# Altium project PCB_Project.PrjPcb (part 6 of 8)
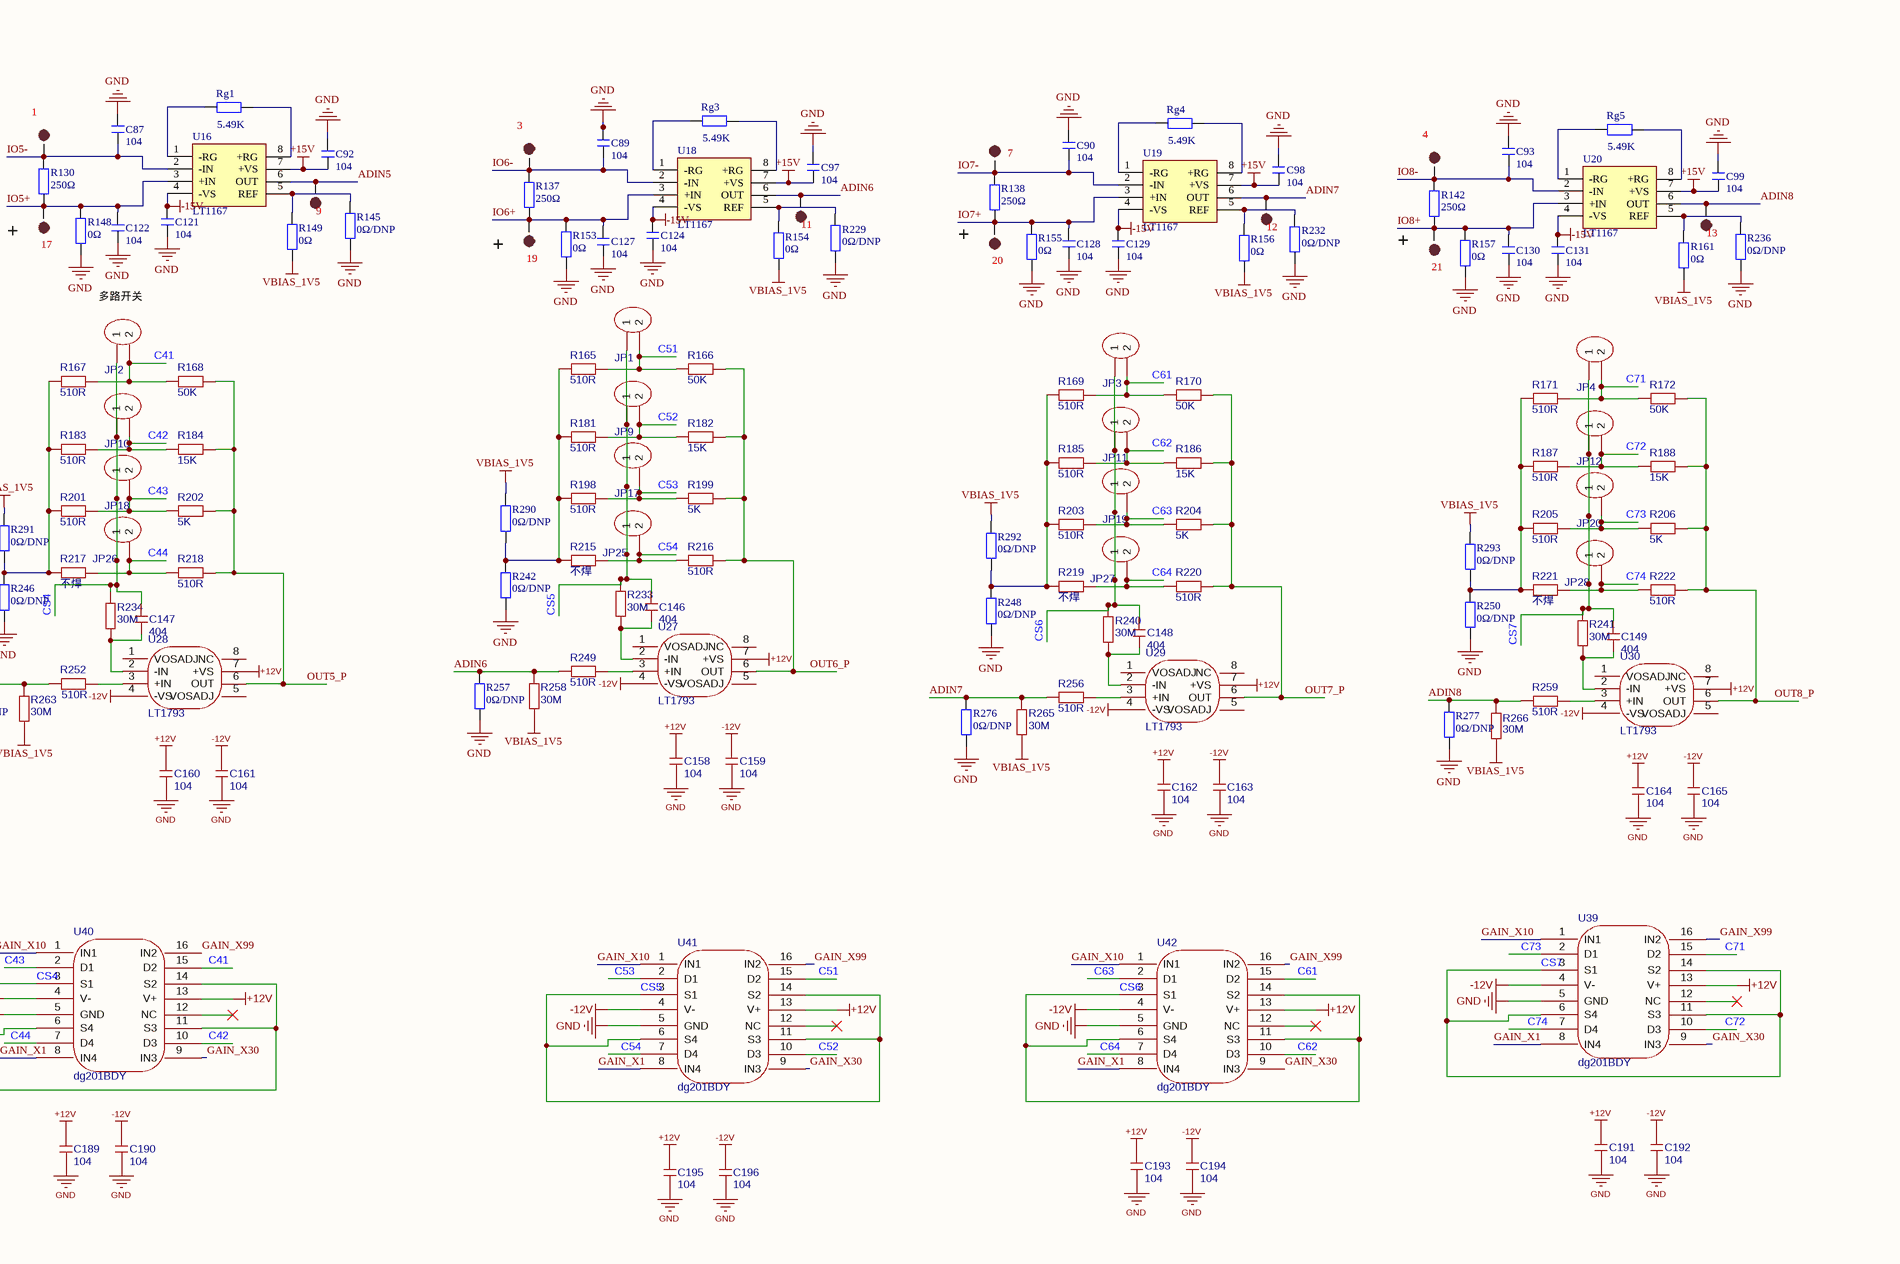
[diagram p107: DSP大板子.SchDoc, bottom right]

## Sheet DSP大板子.SchDoc (continued)
### Library data of the parts (continued)
JP29 = Header 2: 2P接插件; 版权归属: 封装库来自淘宝 ID：黄晶宝石; Origin Footprint: XH2.54-WI-2P; OriginFootprint 2: XH2.54-LI-2P; OriginFootprint 3: HDR2.54-M-LI-2P; OriginFootprint 4: HDR2.54-WI-2P; OriginFootprint 5: HDR2.54-WS-2P; OriginFootprint 7: HDR2.54-M-WS-2P; OriginFootprint 8: KF2510-LI-2P; OriginFootprint 9: XH2.54-WS-2P; OriginFootprint 10: XH2.54-LS-2P; OriginFootprint 11: KF2EDGK-2.54-LI-2P; OriginFootprint 12: KF2EDGK-2.54-WI-2P; UniqueId: 12cb931c49908c91; AddInBom: yes; OriginModelName: HDR2.54-1P; Device: Header 2; BOM名称: 2P接插件; 联系售后: https://shop463601444.taobao.com; OriginFootprint 6: HDR2.54-Y-LI-2P; DesignItemID: Header 2; LibraryName: 5.4 - 接插件-脚距2.54 (100mil); SymbolName: Header 2; FootprintName: HDR2.54-LI-2P
JP30 = Header 2: 2P接插件; 版权归属: 封装库来自淘宝 ID：黄晶宝石; Origin Footprint: XH2.54-WI-2P; OriginFootprint 2: XH2.54-LI-2P; OriginFootprint 3: HDR2.54-M-LI-2P; OriginFootprint 4: HDR2.54-WI-2P; OriginFootprint 5: HDR2.54-WS-2P; OriginFootprint 7: HDR2.54-M-WS-2P; OriginFootprint 8: KF2510-LI-2P; OriginFootprint 9: XH2.54-WS-2P; OriginFootprint 10: XH2.54-LS-2P; OriginFootprint 11: KF2EDGK-2.54-LI-2P; OriginFootprint 12: KF2EDGK-2.54-WI-2P; UniqueId: c76a900f0ccf0344; AddInBom: yes; OriginModelName: HDR2.54-1P; Device: Header 2; BOM名称: 2P接插件; 联系售后: https://shop463601444.taobao.com; OriginFootprint 6: HDR2.54-Y-LI-2P; DesignItemID: Header 2; LibraryName: 5.4 - 接插件-脚距2.54 (100mil); SymbolName: Header 2; FootprintName: HDR2.54-LI-2P
JP31 = Header 2: 2P接插件; 版权归属: 封装库来自淘宝 ID：黄晶宝石; Origin Footprint: XH2.54-WI-2P; OriginFootprint 2: XH2.54-LI-2P; OriginFootprint 3: HDR2.54-M-LI-2P; OriginFootprint 4: HDR2.54-WI-2P; OriginFootprint 5: HDR2.54-WS-2P; OriginFootprint 7: HDR2.54-M-WS-2P; OriginFootprint 8: KF2510-LI-2P; OriginFootprint 9: XH2.54-WS-2P; OriginFootprint 10: XH2.54-LS-2P; OriginFootprint 11: KF2EDGK-2.54-LI-2P; OriginFootprint 12: KF2EDGK-2.54-WI-2P; UniqueId: 3883b53b87c5b88a; AddInBom: yes; OriginModelName: HDR2.54-1P; Device: Header 2; BOM名称: 2P接插件; 联系售后: https://shop463601444.taobao.com; OriginFootprint 6: HDR2.54-Y-LI-2P; DesignItemID: Header 2; LibraryName: 5.4 - 接插件-脚距2.54 (100mil); SymbolName: Header 2; FootprintName: HDR2.54-LI-2P
JP32 = Header 2: 2P接插件; 版权归属: 封装库来自淘宝 ID：黄晶宝石; Origin Footprint: XH2.54-WI-2P; OriginFootprint 2: XH2.54-LI-2P; OriginFootprint 3: HDR2.54-M-LI-2P; OriginFootprint 4: HDR2.54-WI-2P; OriginFootprint 5: HDR2.54-WS-2P; OriginFootprint 7: HDR2.54-M-WS-2P; OriginFootprint 8: KF2510-LI-2P; OriginFootprint 9: XH2.54-WS-2P; OriginFootprint 10: XH2.54-LS-2P; OriginFootprint 11: KF2EDGK-2.54-LI-2P; OriginFootprint 12: KF2EDGK-2.54-WI-2P; UniqueId: 4fe8deccf3ecd12b; AddInBom: yes; OriginModelName: HDR2.54-1P; Device: Header 2; BOM名称: 2P接插件; 联系售后: https://shop463601444.taobao.com; OriginFootprint 6: HDR2.54-Y-LI-2P; DesignItemID: Header 2; LibraryName: 5.4 - 接插件-脚距2.54 (100mil); SymbolName: Header 2; FootprintName: HDR2.54-LI-2P
JTAG1 = 2.54-2*7P简牛: Manufacturer: BOOMELE(博穆精密); Symbol: HDR-IDC-2.54-2X7P; Add into BOM: yes; Connector Type: 简牛座; Pitch: 2.54mm; Structure: 2x7P; Holder Type: 直插; Pin Number in each Row: 7; Device: 2.54-2*7P简牛; LCSC Part Name: 2.54mm 2x7P 排数:2 每排P数:7; Supplier Part: C11215; Manufacturer Part: 2.54-2*7P简牛; Supplier Footprint: 插件,P=2.54mm; JLCPCB Part Class: 扩展库; Datasheet: https://atta.szlcsc.com/upload/public/pdf/source/20131122/1457706661483.pdf; Supplier: LCSC; Convert to PCB: yes; Row Spacing: 2.54mm; Number of Rows: 2; Contact Material: 黄铜; Contact Plating: 金
L1 = blm18kg601sn1d: 阻抗@频率:600Ω@100MHz;误差:±25%;直流电阻(DCR):150mΩ;; Manufacturer: muRata(村田); AddInBom: yes; ModelId: 2bc5ec593d464d6ba9807aec0b5673c2; ModelName: L0603_L1.6-W0.8-H0.5_BEAD; ModelTransform: 62.992,31.496,0,180,0,0,0.094,0.629,0; Tolerance: ±25%; DC Resistance(DCR): 150mΩ; Current Rating: 1.3A; Number of Circuits: 1; Symbol: BLM18KG601SN1D; LCSC Part Name: 单路 0603磁珠 阻抗600Ω@100MHz; SupplierPart: C85833; ManufacturerPart: BLM18KG601SN1D; Supplier Footprint: 0603; JLCPCB Part Class: Extended Part; Datasheet: https://item.szlcsc.com/datasheet/BLM18KG601SN1D/87009.html; Supplier: LCSC; ConvertToPcb: yes; FootprintName: L0603; Impedance @ Frequency: 600Ω@100MHz; Operating Temperature: -55℃~+125℃
L2 = mpz1608s221ata00: 标称阻抗@测试频率:220Ω@100MHz;误差:±25%;直流电阻(RDC):50mΩ;; Manufacturer: TDK; AddInBom: yes; ModelId: 2bc5ec593d464d6ba9807aec0b5673c2; ModelName: L0603_L1.6-W0.8-H0.5_BEAD; ModelTransform: 62.992,31.496,0,180,0,0,0.094,0.629,0; Tolerance: ±25%; DC Resistance: 50mΩ; Current Rating: 2.2A; Circuits: 1; Symbol: MPZ1608S221ATA00; LCSC Part Name: 单路 0603磁珠 阻抗220Ω@100MHz; SupplierPart: C76815; ManufacturerPart: MPZ1608S221ATA00; Supplier Footprint: 0603; JLCPCB Part Class: Extended Part; Datasheet: https://atta.szlcsc.com/upload/public/pdf/source/20160918/1474166931723.pdf; Supplier: LCSC; ConvertToPcb: yes; FootprintName: L0603; Impedance @ Frequency: 220Ω@100MHz
L3 = 7447798720: 电感值:7.2uH;精度:±30%;额定电流:7.9A;饱和电流(Isat):6A;类型:-;; Manufacturer: Wurth(伍尔特); AddInBom: yes; ModelId: 669184afeb3a41a69bd447d1aa3c6b52; ModelTransform: 401.574,402.3614,0,270,0,0,0,0,0; Value: 7.2uH; Tolerance: ±30%; Current Rating: 7.9A; Current - Saturation(Isat): 6A; DC Resistance(DCR): 12.8mΩ; Symbol: 7447798720; LCSC Part Name: 7.2uH ±30% 6A; SupplierPart: C105681; ManufacturerPart: 7447798720; Supplier Footprint: SMD,10.2x10.2mm; JLCPCB Part Class: Extended Part; Datasheet: https://www.we-online.com/components/products/datasheet/7447798720.pdf; Supplier: LCSC; ConvertToPcb: yes; FootprintName: IND-SMD_L10.2-W10.2_7447798720; ModelName: IND-SMD_L10.2-W10.2_7447798720; Type: -; Ratings: -
L4 = Inductor: Code_IEC: 1005; Value: 15uH   0.6A; Published: 8-Jun-2000; LatestRevisionDate: 29-May-2009; LatestRevisionNote: IPC-7351 Footprint Added.; PackageReference: 0402-A; Publisher: Altium Limited; PackageDescription: Chip Inductor; Code_JEITA: 0402
L5 L7 = blm31pg121sn1l: 阻抗@频率:120Ω@100MHz;误差:±25%;直流电阻(DCR):20mΩ;; Manufacturer: muRata(村田); AddInBom: yes; ModelId: 85bdab7b3d4c4074b81d208eb5e865b3; ModelName: L1206_L3.2-W1.6-H1.1; ModelTransform: 125.984,62.835,0,0,0,0,0,0,0; Tolerance: ±25%; DC Resistance(DCR): 20mΩ; Current Rating: 3.5A; Number of Circuits: 1; Symbol: BLM31PG121SN1L; LCSC Part Name: 单路 1206磁珠 阻抗120Ω@100MHz; SupplierPart: C85841; ManufacturerPart: BLM31PG121SN1L; Supplier Footprint: 1206; JLCPCB Part Class: Extended Part; Datasheet: https://item.szlcsc.com/datasheet/BLM31PG121SN1L/87017.html; Supplier: LCSC; ConvertToPcb: yes; FootprintName: L1206; Impedance @ Frequency: 120Ω@100MHz; Operating Temperature: -55℃~+125℃
L6 = srn6045ta-4r7m: 电感值:4.7uH;精度:±20%;额定电流:4.5A;饱和电流(Isat):6.8A;类型:-;; Manufacturer: BOURNS; AddInBom: yes; ModelId: 30081a2752cd45e4871fd4480d5f295c; ModelName: IND-SMD_L6.0-W6.0-H4.5; ModelTransform: 236.22,237.007,0,90,0,0,-0.005,0,0; Value: 4.7uH; Tolerance: ±20%; Current Rating: 4.5A; Current - Saturation(Isat): 6.8A; DC Resistance(DCR): 26mΩ; Symbol: SRN6045TA-4R7M; LCSC Part Name: 4.7uH ±20% 6.8A; SupplierPart: C2044594; ManufacturerPart: SRN6045TA-4R7M; Supplier Footprint: SMD,6x6mm; JLCPCB Part Class: Extended Part; Datasheet: https://item.szlcsc.com/datasheet/SRN6045TA-4R7M/2136160.html; Supplier: LCSC; ConvertToPcb: yes; FootprintName: IND-SMD_L6.0-W6.0; Type: -
OSC1 = ot2el4c4ji-111olp-24.576m: 频率:24.576MHz;常温频差:±10ppm;输出模式:CMOS;工作电压:1.8V~3.3V;频率稳定度:±20ppm;; Manufacturer: YXC(扬兴晶振); AddInBom: yes; ModelId: ae22b8d143894765bc8100c37cb6356f; ModelName: OSC-SMD_4P-L3.2-W2.5-H1.0; ModelTransform: 125.984,98.425,0,0,0,0,0,0,0; Normal temperature Frequency Tolerance: ±10ppm; Output Type: CMOS; Frequency Stability: ±20ppm; Symbol: OT2EL4C4JI-111OLP-24.576M; LCSC Part Name: YSO110TR 24.576MHZ 1.8V-3.3V ±10PPM -40~85℃（±20PPM) CMOS; SupplierPart: C5203547; ManufacturerPart: OT2EL4C4JI-111OLP-24.576M; Supplier Footprint: SMD3225-4P; JLCPCB Part Class: Extended Part; Datasheet: https://item.szlcsc.com/datasheet/OT2EL4C4JI-111OLP-24.576M/5892909.html; Supplier: LCSC; ConvertToPcb: yes; FootprintName: OSC-SMD_4P-L3.2-W2.5-BL; Value: 24.576MHz; Voltage - Supply: 1.8V~3.3V; Operating Temperature: -40℃~+85℃
P1 = wj500v-5.08-03p-14-00a: 结构:1x3P;间距:5.08mm;颜色:绿色;安装类型:直插;排数:1;每排PIN数:3;额定电流:18A;额定电压:250V;线规 - AWG:14~30;线规 - 平方毫米:2.5;工作温度:-40℃~+105℃;; Manufacturer: KANGNEX(康奈克斯电气); Symbol: WJ500V-5.08-3P-14-00A; AddInBom: yes; ModelId: f80d5090781743d49abcb05979f5618f; ModelTransform: 623.621,393.7,0,0,0,0,11.811,-20.315,-177.165; Number of Positions or Pins: 1x3P; Pitch: 5.08mm; Number of PINs Per Row: 3; Screw Specification: M2.5; Current Rating: 18A; Voltage Rating (Max): 250V; Wire Gauge - AWG: 14~30; Wire Gauge - mm2: 2.5; LCSC Part Name: 1x3P 5.08mm 直插 排数:1 每排P数:3; SupplierPart: C72334; ManufacturerPart: WJ500V-5.08-03P-14-00A; Supplier Footprint: 插件,P=5.08mm; JLCPCB Part Class: Extended Part; Datasheet: https://item.szlcsc.com/datasheet/WJ500V-5.08-03P-14-00A/73443.html; Supplier: LCSC; ConvertToPcb: yes; FootprintName: CONN-TH_3P-P5.00_WJ500V-5.08-3P; ModelName: CONN-TH_3P-P5.00_WJ500V-5.08-3P; Color: 绿色; Mounting Type: 直插; Number of Pins: 3P; Number of Rows: 1; Operating Temperature: -40℃~+105℃; Height Above Board: 14.07mm
P2 = Header 2: Header, 2-Pin; LatestRevisionDate: 17-Jul-2002; LatestRevisionNote: Re-released for DXP Platform.; Publisher: Altium Limited
Q1 = 2n7002,215: 数量:1个N沟道;漏源电压(Vdss):60V;连续漏极电流(Id):300mA;导通电阻(RDS(on)):5Ω@10V;耗散功率(Pd):830mW;阈值电压(Vgs(th)):2.5V;; Manufacturer: Nexperia(安世); AddInBom: yes; ModelId: c62791f0466c4ae2a892c056b845b0ca; ModelName: SOT-23-3P_L2.9-W1.3-H1.0-LS2.4-P0.95; ModelTransform: 98.64468,114.173,0,180,0,0,0.001,-0.002,0; Number: 1个N沟道; Drain to Source Voltage: 60V; Current - Continuous Drain(Id): 300mA; RDS(on): 5Ω@10V; Pd - Power Dissipation: 830mW; Gate Threshold Voltage (Vgs(th)): 2.5V; Input Capacitance(Ciss): 50pF; Reverse Transfer Capacitance (Crss@Vds): 3.5pF; Type: N沟道; Output Capacitance(Coss): 6.8pF; Vgs: ±30V; Symbol: 2N7002,215; LCSC Part Name: 1个N沟道 耐压:60V 电流:300mA; SupplierPart: C65189; ManufacturerPart: 2N7002,215; Supplier Footprint: SOT-23; JLCPCB Part Class: Extended Part; Datasheet: https://item.szlcsc.com/datasheet/2N7002%252C215/66260.html; Supplier: LCSC; ConvertToPcb: yes; FootprintName: SOT-23_L2.9-W1.3-P1.90-LS2.4-BR; Gate Charge(Qg): -; Operating Temperature: -65℃~+150℃; Configuration: -
Q2 = dmp6023le-13: 数量:1个P沟道;漏源电压(Vdss):60V;连续漏极电流(Id):7A;导通电阻(RDS(on)):35mΩ@4.5V;耗散功率(Pd):2W;阈值电压(Vgs(th)):3V;; Manufacturer: DIODES(美台); AddInBom: yes; ModelId: 925194bf9823436183a3e0b978a8d076; ModelName: SOT-223-4P_L6.5-W3.5-H1.6-LS7.0-P2.30; ModelTransform: 279.89794,255.905,0,180,0,0,-0.0005,-0.0005,0; Number: 1个P沟道; Drain to Source Voltage: 60V; Current - Continuous Drain(Id): 7A; Pd - Power Dissipation: 2W; Gate Threshold Voltage (Vgs(th)): 3V; Gate Charge(Qg): 53.1nC@10V; Input Capacitance(Ciss): 2.569nF; Reverse Transfer Capacitance (Crss@Vds): 143pF; Type: P沟道; Output Capacitance(Coss): 179pF; Symbol: DMP6023LE-13; LCSC Part Name: 1个P沟道 耐压:60V 电流:7A; SupplierPart: C154901; ManufacturerPart: DMP6023LE-13; Supplier Footprint: SOT-223; JLCPCB Part Class: Extended Part; Datasheet: https://item.szlcsc.com/datasheet/DMP6023LE-13/166243.html; Supplier: LCSC; ConvertToPcb: yes; FootprintName: SOT-223-4_L6.5-W3.5-P2.30-LS7.0-BR; RDS(on): 35mΩ@4.5V; Operating Temperature: -55℃~+150℃
R1 R5 R10 R15 R30 R32-R34 R41 R42 R44 R45 R49 R51 R54 R55 R72 R75 R76 R78-R81 R83-R85 R90 R92-R94 R96-R119 R121 R122 R124 R125 R127-R132 R136-R138 R142-R164 R195 R200 R229 R232 R235-R239 R242 R246 R248 R250 R251 R253-R255 R257 R273 R275-R303 Rg1-Rg8 = R: 贴片电阻; 版权归属: 来自淘宝 ID：黄晶宝石; 封装库来自淘宝卖家 ID：黄晶宝石: 其他店铺购入均为盗版，不享受售后技术支持服务，请立即申请退款; BOM名称: 贴片电阻; 联系售后: https://shop463601444.taobao.com
R2-R4 R6-R9 R11-R14 R16 R17 R19-R23 R25 R29 R35-R40 R43 R46-R48 R50 R52 R53 R56-R62 R65 R67 R69-R71 R73 R74 R77 R82 R86 R87 R89 R91 R95 R120 R123 R126 R133-R135 R139-R141 = R: 贴片电阻; 版权归属: 源创客; BOM名称: 贴片电阻; 学习资源: www.ooocke.com
R18 R24 R26-R28 R31 R63 R64 R66 R68 = R_10: 贴片电阻; 版权归属: 源创客; BOM名称: 贴片电阻; 学习资源: www.ooocke.com
R88 = R: 贴片电阻1%; BOM名称: 贴片电阻; 版权归属: 来自淘宝 ID：黄晶宝石; 封装库来自淘宝卖家 ID：黄晶宝石: 其他店铺购入均为盗版，不享受售后技术支持服务，请立即申请退款; 联系售后: https://shop463601444.taobao.com
R165 = R: 贴片电阻; 版权归属: 来自淘宝 ID：黄晶宝石; 封装库来自淘宝卖家 ID：黄晶宝石: 其他店铺购入均为盗版，不享受售后技术支持服务，请立即申请退款; Origin Footprint: R 0201_L; OriginFootprint 2: R 0402_L; OriginFootprint 3: R 0805_L; OriginFootprint 4: R 1206_L; OriginFootprint 5: R 1210_L; OriginFootprint 6: R 1812_L; OriginFootprint 7: R 2010_L; OriginFootprint 8: R 2512_L; OriginFootprint 9: R 0201_M; OriginFootprint 10: R 0402_M; OriginFootprint 11: R 0603_M; OriginFootprint 12: R 0805_M; OriginFootprint 13: R 1206_M; OriginFootprint 14: R 1210_M; OriginFootprint 15: R 1812_M; OriginFootprint 16: R 2010_M; OriginFootprint 17: R 2512_M; UniqueId: 60493bf970b6a222; AddInBom: yes; OriginModelName: R 0603; Device: R; BOM名称: 贴片电阻; 联系售后: https://shop463601444.taobao.com; DesignItemID: R; LibraryName: 0.1 - 电阻-电容-电感; SymbolName: R; FootprintName: R 0603_L
R166 = R: 贴片电阻; 版权归属: 来自淘宝 ID：黄晶宝石; 封装库来自淘宝卖家 ID：黄晶宝石: 其他店铺购入均为盗版，不享受售后技术支持服务，请立即申请退款; Origin Footprint: R 0201_L; OriginFootprint 2: R 0402_L; OriginFootprint 3: R 0805_L; OriginFootprint 4: R 1206_L; OriginFootprint 5: R 1210_L; OriginFootprint 6: R 1812_L; OriginFootprint 7: R 2010_L; OriginFootprint 8: R 2512_L; OriginFootprint 9: R 0201_M; OriginFootprint 10: R 0402_M; OriginFootprint 11: R 0603_M; OriginFootprint 12: R 0805_M; OriginFootprint 13: R 1206_M; OriginFootprint 14: R 1210_M; OriginFootprint 15: R 1812_M; OriginFootprint 16: R 2010_M; OriginFootprint 17: R 2512_M; UniqueId: 4cc02cdac8efc8e2; AddInBom: yes; OriginModelName: R 0603; Device: R; BOM名称: 贴片电阻; 联系售后: https://shop463601444.taobao.com; DesignItemID: R; LibraryName: 0.1 - 电阻-电容-电感; SymbolName: R; FootprintName: R 0603_L
R167 = R: 贴片电阻; 版权归属: 来自淘宝 ID：黄晶宝石; 封装库来自淘宝卖家 ID：黄晶宝石: 其他店铺购入均为盗版，不享受售后技术支持服务，请立即申请退款; Origin Footprint: R 0201_L; OriginFootprint 2: R 0402_L; OriginFootprint 3: R 0805_L; OriginFootprint 4: R 1206_L; OriginFootprint 5: R 1210_L; OriginFootprint 6: R 1812_L; OriginFootprint 7: R 2010_L; OriginFootprint 8: R 2512_L; OriginFootprint 9: R 0201_M; OriginFootprint 10: R 0402_M; OriginFootprint 11: R 0603_M; OriginFootprint 12: R 0805_M; OriginFootprint 13: R 1206_M; OriginFootprint 14: R 1210_M; OriginFootprint 15: R 1812_M; OriginFootprint 16: R 2010_M; OriginFootprint 17: R 2512_M; UniqueId: ef32c3a96261eb70; AddInBom: yes; OriginModelName: R 0603; Device: R; BOM名称: 贴片电阻; 联系售后: https://shop463601444.taobao.com; DesignItemID: R; LibraryName: 0.1 - 电阻-电容-电感; SymbolName: R; FootprintName: R 0603_L
R168 = R: 贴片电阻; 版权归属: 来自淘宝 ID：黄晶宝石; 封装库来自淘宝卖家 ID：黄晶宝石: 其他店铺购入均为盗版，不享受售后技术支持服务，请立即申请退款; Origin Footprint: R 0201_L; OriginFootprint 2: R 0402_L; OriginFootprint 3: R 0805_L; OriginFootprint 4: R 1206_L; OriginFootprint 5: R 1210_L; OriginFootprint 6: R 1812_L; OriginFootprint 7: R 2010_L; OriginFootprint 8: R 2512_L; OriginFootprint 9: R 0201_M; OriginFootprint 10: R 0402_M; OriginFootprint 11: R 0603_M; OriginFootprint 12: R 0805_M; OriginFootprint 13: R 1206_M; OriginFootprint 14: R 1210_M; OriginFootprint 15: R 1812_M; OriginFootprint 16: R 2010_M; OriginFootprint 17: R 2512_M; UniqueId: b2ee10c0a9f54310; AddInBom: yes; OriginModelName: R 0603; Device: R; BOM名称: 贴片电阻; 联系售后: https://shop463601444.taobao.com; DesignItemID: R; LibraryName: 0.1 - 电阻-电容-电感; SymbolName: R; FootprintName: R 0603_L
R169 = R: 贴片电阻; 版权归属: 来自淘宝 ID：黄晶宝石; 封装库来自淘宝卖家 ID：黄晶宝石: 其他店铺购入均为盗版，不享受售后技术支持服务，请立即申请退款; Origin Footprint: R 0201_L; OriginFootprint 2: R 0402_L; OriginFootprint 3: R 0805_L; OriginFootprint 4: R 1206_L; OriginFootprint 5: R 1210_L; OriginFootprint 6: R 1812_L; OriginFootprint 7: R 2010_L; OriginFootprint 8: R 2512_L; OriginFootprint 9: R 0201_M; OriginFootprint 10: R 0402_M; OriginFootprint 11: R 0603_M; OriginFootprint 12: R 0805_M; OriginFootprint 13: R 1206_M; OriginFootprint 14: R 1210_M; OriginFootprint 15: R 1812_M; OriginFootprint 16: R 2010_M; OriginFootprint 17: R 2512_M; UniqueId: e6add4189764555f; AddInBom: yes; OriginModelName: R 0603; Device: R; BOM名称: 贴片电阻; 联系售后: https://shop463601444.taobao.com; DesignItemID: R; LibraryName: 0.1 - 电阻-电容-电感; SymbolName: R; FootprintName: R 0603_L
R170 = R: 贴片电阻; 版权归属: 来自淘宝 ID：黄晶宝石; 封装库来自淘宝卖家 ID：黄晶宝石: 其他店铺购入均为盗版，不享受售后技术支持服务，请立即申请退款; Origin Footprint: R 0201_L; OriginFootprint 2: R 0402_L; OriginFootprint 3: R 0805_L; OriginFootprint 4: R 1206_L; OriginFootprint 5: R 1210_L; OriginFootprint 6: R 1812_L; OriginFootprint 7: R 2010_L; OriginFootprint 8: R 2512_L; OriginFootprint 9: R 0201_M; OriginFootprint 10: R 0402_M; OriginFootprint 11: R 0603_M; OriginFootprint 12: R 0805_M; OriginFootprint 13: R 1206_M; OriginFootprint 14: R 1210_M; OriginFootprint 15: R 1812_M; OriginFootprint 16: R 2010_M; OriginFootprint 17: R 2512_M; UniqueId: e7f646629e87fbc8; AddInBom: yes; OriginModelName: R 0603; Device: R; BOM名称: 贴片电阻; 联系售后: https://shop463601444.taobao.com; DesignItemID: R; LibraryName: 0.1 - 电阻-电容-电感; SymbolName: R; FootprintName: R 0603_L
R171 = R: 贴片电阻; 版权归属: 来自淘宝 ID：黄晶宝石; 封装库来自淘宝卖家 ID：黄晶宝石: 其他店铺购入均为盗版，不享受售后技术支持服务，请立即申请退款; Origin Footprint: R 0201_L; OriginFootprint 2: R 0402_L; OriginFootprint 3: R 0805_L; OriginFootprint 4: R 1206_L; OriginFootprint 5: R 1210_L; OriginFootprint 6: R 1812_L; OriginFootprint 7: R 2010_L; OriginFootprint 8: R 2512_L; OriginFootprint 9: R 0201_M; OriginFootprint 10: R 0402_M; OriginFootprint 11: R 0603_M; OriginFootprint 12: R 0805_M; OriginFootprint 13: R 1206_M; OriginFootprint 14: R 1210_M; OriginFootprint 15: R 1812_M; OriginFootprint 16: R 2010_M; OriginFootprint 17: R 2512_M; UniqueId: 21524ddd3d38a4e3; AddInBom: yes; OriginModelName: R 0603; Device: R; BOM名称: 贴片电阻; 联系售后: https://shop463601444.taobao.com; DesignItemID: R; LibraryName: 0.1 - 电阻-电容-电感; SymbolName: R; FootprintName: R 0603_L
R172 = R: 贴片电阻; 版权归属: 来自淘宝 ID：黄晶宝石; 封装库来自淘宝卖家 ID：黄晶宝石: 其他店铺购入均为盗版，不享受售后技术支持服务，请立即申请退款; Origin Footprint: R 0201_L; OriginFootprint 2: R 0402_L; OriginFootprint 3: R 0805_L; OriginFootprint 4: R 1206_L; OriginFootprint 5: R 1210_L; OriginFootprint 6: R 1812_L; OriginFootprint 7: R 2010_L; OriginFootprint 8: R 2512_L; OriginFootprint 9: R 0201_M; OriginFootprint 10: R 0402_M; OriginFootprint 11: R 0603_M; OriginFootprint 12: R 0805_M; OriginFootprint 13: R 1206_M; OriginFootprint 14: R 1210_M; OriginFootprint 15: R 1812_M; OriginFootprint 16: R 2010_M; OriginFootprint 17: R 2512_M; UniqueId: 214b1954295082c1; AddInBom: yes; OriginModelName: R 0603; Device: R; BOM名称: 贴片电阻; 联系售后: https://shop463601444.taobao.com; DesignItemID: R; LibraryName: 0.1 - 电阻-电容-电感; SymbolName: R; FootprintName: R 0603_L
R173 = R: 贴片电阻; 版权归属: 来自淘宝 ID：黄晶宝石; 封装库来自淘宝卖家 ID：黄晶宝石: 其他店铺购入均为盗版，不享受售后技术支持服务，请立即申请退款; Origin Footprint: R 0201_L; OriginFootprint 2: R 0402_L; OriginFootprint 3: R 0805_L; OriginFootprint 4: R 1206_L; OriginFootprint 5: R 1210_L; OriginFootprint 6: R 1812_L; OriginFootprint 7: R 2010_L; OriginFootprint 8: R 2512_L; OriginFootprint 9: R 0201_M; OriginFootprint 10: R 0402_M; OriginFootprint 11: R 0603_M; OriginFootprint 12: R 0805_M; OriginFootprint 13: R 1206_M; OriginFootprint 14: R 1210_M; OriginFootprint 15: R 1812_M; OriginFootprint 16: R 2010_M; OriginFootprint 17: R 2512_M; UniqueId: 8a972535593efa61; AddInBom: yes; OriginModelName: R 0603; Device: R; BOM名称: 贴片电阻; 联系售后: https://shop463601444.taobao.com; DesignItemID: R; LibraryName: 0.1 - 电阻-电容-电感; SymbolName: R; FootprintName: R 0603_L
R174 = R: 贴片电阻; 版权归属: 来自淘宝 ID：黄晶宝石; 封装库来自淘宝卖家 ID：黄晶宝石: 其他店铺购入均为盗版，不享受售后技术支持服务，请立即申请退款; Origin Footprint: R 0201_L; OriginFootprint 2: R 0402_L; OriginFootprint 3: R 0805_L; OriginFootprint 4: R 1206_L; OriginFootprint 5: R 1210_L; OriginFootprint 6: R 1812_L; OriginFootprint 7: R 2010_L; OriginFootprint 8: R 2512_L; OriginFootprint 9: R 0201_M; OriginFootprint 10: R 0402_M; OriginFootprint 11: R 0603_M; OriginFootprint 12: R 0805_M; OriginFootprint 13: R 1206_M; OriginFootprint 14: R 1210_M; OriginFootprint 15: R 1812_M; OriginFootprint 16: R 2010_M; OriginFootprint 17: R 2512_M; UniqueId: 0c441820cbabe695; AddInBom: yes; OriginModelName: R 0603; Device: R; BOM名称: 贴片电阻; 联系售后: https://shop463601444.taobao.com; DesignItemID: R; LibraryName: 0.1 - 电阻-电容-电感; SymbolName: R; FootprintName: R 0603_L
R175 = R: 贴片电阻; 版权归属: 来自淘宝 ID：黄晶宝石; 封装库来自淘宝卖家 ID：黄晶宝石: 其他店铺购入均为盗版，不享受售后技术支持服务，请立即申请退款; Origin Footprint: R 0201_L; OriginFootprint 2: R 0402_L; OriginFootprint 3: R 0805_L; OriginFootprint 4: R 1206_L; OriginFootprint 5: R 1210_L; OriginFootprint 6: R 1812_L; OriginFootprint 7: R 2010_L; OriginFootprint 8: R 2512_L; OriginFootprint 9: R 0201_M; OriginFootprint 10: R 0402_M; OriginFootprint 11: R 0603_M; OriginFootprint 12: R 0805_M; OriginFootprint 13: R 1206_M; OriginFootprint 14: R 1210_M; OriginFootprint 15: R 1812_M; OriginFootprint 16: R 2010_M; OriginFootprint 17: R 2512_M; UniqueId: 5d7d37af6db8001c; AddInBom: yes; OriginModelName: R 0603; Device: R; BOM名称: 贴片电阻; 联系售后: https://shop463601444.taobao.com; DesignItemID: R; LibraryName: 0.1 - 电阻-电容-电感; SymbolName: R; FootprintName: R 0603_L
R176 = R: 贴片电阻; 版权归属: 来自淘宝 ID：黄晶宝石; 封装库来自淘宝卖家 ID：黄晶宝石: 其他店铺购入均为盗版，不享受售后技术支持服务，请立即申请退款; Origin Footprint: R 0201_L; OriginFootprint 2: R 0402_L; OriginFootprint 3: R 0805_L; OriginFootprint 4: R 1206_L; OriginFootprint 5: R 1210_L; OriginFootprint 6: R 1812_L; OriginFootprint 7: R 2010_L; OriginFootprint 8: R 2512_L; OriginFootprint 9: R 0201_M; OriginFootprint 10: R 0402_M; OriginFootprint 11: R 0603_M; OriginFootprint 12: R 0805_M; OriginFootprint 13: R 1206_M; OriginFootprint 14: R 1210_M; OriginFootprint 15: R 1812_M; OriginFootprint 16: R 2010_M; OriginFootprint 17: R 2512_M; UniqueId: 37ee6d28f6c4dade; AddInBom: yes; OriginModelName: R 0603; Device: R; BOM名称: 贴片电阻; 联系售后: https://shop463601444.taobao.com; DesignItemID: R; LibraryName: 0.1 - 电阻-电容-电感; SymbolName: R; FootprintName: R 0603_L
R177 = R: 贴片电阻; 版权归属: 来自淘宝 ID：黄晶宝石; 封装库来自淘宝卖家 ID：黄晶宝石: 其他店铺购入均为盗版，不享受售后技术支持服务，请立即申请退款; Origin Footprint: R 0201_L; OriginFootprint 2: R 0402_L; OriginFootprint 3: R 0805_L; OriginFootprint 4: R 1206_L; OriginFootprint 5: R 1210_L; OriginFootprint 6: R 1812_L; OriginFootprint 7: R 2010_L; OriginFootprint 8: R 2512_L; OriginFootprint 9: R 0201_M; OriginFootprint 10: R 0402_M; OriginFootprint 11: R 0603_M; OriginFootprint 12: R 0805_M; OriginFootprint 13: R 1206_M; OriginFootprint 14: R 1210_M; OriginFootprint 15: R 1812_M; OriginFootprint 16: R 2010_M; OriginFootprint 17: R 2512_M; UniqueId: fe3640da4f52432f; AddInBom: yes; OriginModelName: R 0603; Device: R; BOM名称: 贴片电阻; 联系售后: https://shop463601444.taobao.com; DesignItemID: R; LibraryName: 0.1 - 电阻-电容-电感; SymbolName: R; FootprintName: R 0603_L
R178 = R: 贴片电阻; 版权归属: 来自淘宝 ID：黄晶宝石; 封装库来自淘宝卖家 ID：黄晶宝石: 其他店铺购入均为盗版，不享受售后技术支持服务，请立即申请退款; Origin Footprint: R 0201_L; OriginFootprint 2: R 0402_L; OriginFootprint 3: R 0805_L; OriginFootprint 4: R 1206_L; OriginFootprint 5: R 1210_L; OriginFootprint 6: R 1812_L; OriginFootprint 7: R 2010_L; OriginFootprint 8: R 2512_L; OriginFootprint 9: R 0201_M; OriginFootprint 10: R 0402_M; OriginFootprint 11: R 0603_M; OriginFootprint 12: R 0805_M; OriginFootprint 13: R 1206_M; OriginFootprint 14: R 1210_M; OriginFootprint 15: R 1812_M; OriginFootprint 16: R 2010_M; OriginFootprint 17: R 2512_M; UniqueId: d68336a531a39a0c; AddInBom: yes; OriginModelName: R 0603; Device: R; BOM名称: 贴片电阻; 联系售后: https://shop463601444.taobao.com; DesignItemID: R; LibraryName: 0.1 - 电阻-电容-电感; SymbolName: R; FootprintName: R 0603_L
R179 = R: 贴片电阻; 版权归属: 来自淘宝 ID：黄晶宝石; 封装库来自淘宝卖家 ID：黄晶宝石: 其他店铺购入均为盗版，不享受售后技术支持服务，请立即申请退款; Origin Footprint: R 0201_L; OriginFootprint 2: R 0402_L; OriginFootprint 3: R 0805_L; OriginFootprint 4: R 1206_L; OriginFootprint 5: R 1210_L; OriginFootprint 6: R 1812_L; OriginFootprint 7: R 2010_L; OriginFootprint 8: R 2512_L; OriginFootprint 9: R 0201_M; OriginFootprint 10: R 0402_M; OriginFootprint 11: R 0603_M; OriginFootprint 12: R 0805_M; OriginFootprint 13: R 1206_M; OriginFootprint 14: R 1210_M; OriginFootprint 15: R 1812_M; OriginFootprint 16: R 2010_M; OriginFootprint 17: R 2512_M; UniqueId: 6f4c4beafd605d3e; AddInBom: yes; OriginModelName: R 0603; Device: R; BOM名称: 贴片电阻; 联系售后: https://shop463601444.taobao.com; DesignItemID: R; LibraryName: 0.1 - 电阻-电容-电感; SymbolName: R; FootprintName: R 0603_L
R180 = R: 贴片电阻; 版权归属: 来自淘宝 ID：黄晶宝石; 封装库来自淘宝卖家 ID：黄晶宝石: 其他店铺购入均为盗版，不享受售后技术支持服务，请立即申请退款; Origin Footprint: R 0201_L; OriginFootprint 2: R 0402_L; OriginFootprint 3: R 0805_L; OriginFootprint 4: R 1206_L; OriginFootprint 5: R 1210_L; OriginFootprint 6: R 1812_L; OriginFootprint 7: R 2010_L; OriginFootprint 8: R 2512_L; OriginFootprint 9: R 0201_M; OriginFootprint 10: R 0402_M; OriginFootprint 11: R 0603_M; OriginFootprint 12: R 0805_M; OriginFootprint 13: R 1206_M; OriginFootprint 14: R 1210_M; OriginFootprint 15: R 1812_M; OriginFootprint 16: R 2010_M; OriginFootprint 17: R 2512_M; UniqueId: 21d05c86dd1c170d; AddInBom: yes; OriginModelName: R 0603; Device: R; BOM名称: 贴片电阻; 联系售后: https://shop463601444.taobao.com; DesignItemID: R; LibraryName: 0.1 - 电阻-电容-电感; SymbolName: R; FootprintName: R 0603_L
R181 = R: 贴片电阻; 版权归属: 来自淘宝 ID：黄晶宝石; 封装库来自淘宝卖家 ID：黄晶宝石: 其他店铺购入均为盗版，不享受售后技术支持服务，请立即申请退款; Origin Footprint: R 0201_L; OriginFootprint 2: R 0402_L; OriginFootprint 3: R 0805_L; OriginFootprint 4: R 1206_L; OriginFootprint 5: R 1210_L; OriginFootprint 6: R 1812_L; OriginFootprint 7: R 2010_L; OriginFootprint 8: R 2512_L; OriginFootprint 9: R 0201_M; OriginFootprint 10: R 0402_M; OriginFootprint 11: R 0603_M; OriginFootprint 12: R 0805_M; OriginFootprint 13: R 1206_M; OriginFootprint 14: R 1210_M; OriginFootprint 15: R 1812_M; OriginFootprint 16: R 2010_M; OriginFootprint 17: R 2512_M; UniqueId: 409031e5a22b12b4; AddInBom: yes; OriginModelName: R 0603; Device: R; BOM名称: 贴片电阻; 联系售后: https://shop463601444.taobao.com; DesignItemID: R; LibraryName: 0.1 - 电阻-电容-电感; SymbolName: R; FootprintName: R 0603_L
R182 = R: 贴片电阻; 版权归属: 来自淘宝 ID：黄晶宝石; 封装库来自淘宝卖家 ID：黄晶宝石: 其他店铺购入均为盗版，不享受售后技术支持服务，请立即申请退款; Origin Footprint: R 0201_L; OriginFootprint 2: R 0402_L; OriginFootprint 3: R 0805_L; OriginFootprint 4: R 1206_L; OriginFootprint 5: R 1210_L; OriginFootprint 6: R 1812_L; OriginFootprint 7: R 2010_L; OriginFootprint 8: R 2512_L; OriginFootprint 9: R 0201_M; OriginFootprint 10: R 0402_M; OriginFootprint 11: R 0603_M; OriginFootprint 12: R 0805_M; OriginFootprint 13: R 1206_M; OriginFootprint 14: R 1210_M; OriginFootprint 15: R 1812_M; OriginFootprint 16: R 2010_M; OriginFootprint 17: R 2512_M; UniqueId: 4347d18567640c38; AddInBom: yes; OriginModelName: R 0603; Device: R; BOM名称: 贴片电阻; 联系售后: https://shop463601444.taobao.com; DesignItemID: R; LibraryName: 0.1 - 电阻-电容-电感; SymbolName: R; FootprintName: R 0603_L
R183 = R: 贴片电阻; 版权归属: 来自淘宝 ID：黄晶宝石; 封装库来自淘宝卖家 ID：黄晶宝石: 其他店铺购入均为盗版，不享受售后技术支持服务，请立即申请退款; Origin Footprint: R 0201_L; OriginFootprint 2: R 0402_L; OriginFootprint 3: R 0805_L; OriginFootprint 4: R 1206_L; OriginFootprint 5: R 1210_L; OriginFootprint 6: R 1812_L; OriginFootprint 7: R 2010_L; OriginFootprint 8: R 2512_L; OriginFootprint 9: R 0201_M; OriginFootprint 10: R 0402_M; OriginFootprint 11: R 0603_M; OriginFootprint 12: R 0805_M; OriginFootprint 13: R 1206_M; OriginFootprint 14: R 1210_M; OriginFootprint 15: R 1812_M; OriginFootprint 16: R 2010_M; OriginFootprint 17: R 2512_M; UniqueId: eb10a78dcd737970; AddInBom: yes; OriginModelName: R 0603; Device: R; BOM名称: 贴片电阻; 联系售后: https://shop463601444.taobao.com; DesignItemID: R; LibraryName: 0.1 - 电阻-电容-电感; SymbolName: R; FootprintName: R 0603_L
R184 = R: 贴片电阻; 版权归属: 来自淘宝 ID：黄晶宝石; 封装库来自淘宝卖家 ID：黄晶宝石: 其他店铺购入均为盗版，不享受售后技术支持服务，请立即申请退款; Origin Footprint: R 0201_L; OriginFootprint 2: R 0402_L; OriginFootprint 3: R 0805_L; OriginFootprint 4: R 1206_L; OriginFootprint 5: R 1210_L; OriginFootprint 6: R 1812_L; OriginFootprint 7: R 2010_L; OriginFootprint 8: R 2512_L; OriginFootprint 9: R 0201_M; OriginFootprint 10: R 0402_M; OriginFootprint 11: R 0603_M; OriginFootprint 12: R 0805_M; OriginFootprint 13: R 1206_M; OriginFootprint 14: R 1210_M; OriginFootprint 15: R 1812_M; OriginFootprint 16: R 2010_M; OriginFootprint 17: R 2512_M; UniqueId: 35c165bc28534d24; AddInBom: yes; OriginModelName: R 0603; Device: R; BOM名称: 贴片电阻; 联系售后: https://shop463601444.taobao.com; DesignItemID: R; LibraryName: 0.1 - 电阻-电容-电感; SymbolName: R; FootprintName: R 0603_L
R185 = R: 贴片电阻; 版权归属: 来自淘宝 ID：黄晶宝石; 封装库来自淘宝卖家 ID：黄晶宝石: 其他店铺购入均为盗版，不享受售后技术支持服务，请立即申请退款; Origin Footprint: R 0201_L; OriginFootprint 2: R 0402_L; OriginFootprint 3: R 0805_L; OriginFootprint 4: R 1206_L; OriginFootprint 5: R 1210_L; OriginFootprint 6: R 1812_L; OriginFootprint 7: R 2010_L; OriginFootprint 8: R 2512_L; OriginFootprint 9: R 0201_M; OriginFootprint 10: R 0402_M; OriginFootprint 11: R 0603_M; OriginFootprint 12: R 0805_M; OriginFootprint 13: R 1206_M; OriginFootprint 14: R 1210_M; OriginFootprint 15: R 1812_M; OriginFootprint 16: R 2010_M; OriginFootprint 17: R 2512_M; UniqueId: 81c939669f251c31; AddInBom: yes; OriginModelName: R 0603; Device: R; BOM名称: 贴片电阻; 联系售后: https://shop463601444.taobao.com; DesignItemID: R; LibraryName: 0.1 - 电阻-电容-电感; SymbolName: R; FootprintName: R 0603_L
R186 = R: 贴片电阻; 版权归属: 来自淘宝 ID：黄晶宝石; 封装库来自淘宝卖家 ID：黄晶宝石: 其他店铺购入均为盗版，不享受售后技术支持服务，请立即申请退款; Origin Footprint: R 0201_L; OriginFootprint 2: R 0402_L; OriginFootprint 3: R 0805_L; OriginFootprint 4: R 1206_L; OriginFootprint 5: R 1210_L; OriginFootprint 6: R 1812_L; OriginFootprint 7: R 2010_L; OriginFootprint 8: R 2512_L; OriginFootprint 9: R 0201_M; OriginFootprint 10: R 0402_M; OriginFootprint 11: R 0603_M; OriginFootprint 12: R 0805_M; OriginFootprint 13: R 1206_M; OriginFootprint 14: R 1210_M; OriginFootprint 15: R 1812_M; OriginFootprint 16: R 2010_M; OriginFootprint 17: R 2512_M; UniqueId: e41387fe6cfc9cb2; AddInBom: yes; OriginModelName: R 0603; Device: R; BOM名称: 贴片电阻; 联系售后: https://shop463601444.taobao.com; DesignItemID: R; LibraryName: 0.1 - 电阻-电容-电感; SymbolName: R; FootprintName: R 0603_L
R187 = R: 贴片电阻; 版权归属: 来自淘宝 ID：黄晶宝石; 封装库来自淘宝卖家 ID：黄晶宝石: 其他店铺购入均为盗版，不享受售后技术支持服务，请立即申请退款; Origin Footprint: R 0201_L; OriginFootprint 2: R 0402_L; OriginFootprint 3: R 0805_L; OriginFootprint 4: R 1206_L; OriginFootprint 5: R 1210_L; OriginFootprint 6: R 1812_L; OriginFootprint 7: R 2010_L; OriginFootprint 8: R 2512_L; OriginFootprint 9: R 0201_M; OriginFootprint 10: R 0402_M; OriginFootprint 11: R 0603_M; OriginFootprint 12: R 0805_M; OriginFootprint 13: R 1206_M; OriginFootprint 14: R 1210_M; OriginFootprint 15: R 1812_M; OriginFootprint 16: R 2010_M; OriginFootprint 17: R 2512_M; UniqueId: 0a743140f9ea7b14; AddInBom: yes; OriginModelName: R 0603; Device: R; BOM名称: 贴片电阻; 联系售后: https://shop463601444.taobao.com; DesignItemID: R; LibraryName: 0.1 - 电阻-电容-电感; SymbolName: R; FootprintName: R 0603_L
R188 = R: 贴片电阻; 版权归属: 来自淘宝 ID：黄晶宝石; 封装库来自淘宝卖家 ID：黄晶宝石: 其他店铺购入均为盗版，不享受售后技术支持服务，请立即申请退款; Origin Footprint: R 0201_L; OriginFootprint 2: R 0402_L; OriginFootprint 3: R 0805_L; OriginFootprint 4: R 1206_L; OriginFootprint 5: R 1210_L; OriginFootprint 6: R 1812_L; OriginFootprint 7: R 2010_L; OriginFootprint 8: R 2512_L; OriginFootprint 9: R 0201_M; OriginFootprint 10: R 0402_M; OriginFootprint 11: R 0603_M; OriginFootprint 12: R 0805_M; OriginFootprint 13: R 1206_M; OriginFootprint 14: R 1210_M; OriginFootprint 15: R 1812_M; OriginFootprint 16: R 2010_M; OriginFootprint 17: R 2512_M; UniqueId: c8e7fea75ae2c195; AddInBom: yes; OriginModelName: R 0603; Device: R; BOM名称: 贴片电阻; 联系售后: https://shop463601444.taobao.com; DesignItemID: R; LibraryName: 0.1 - 电阻-电容-电感; SymbolName: R; FootprintName: R 0603_L
R189 = R: 贴片电阻; 版权归属: 来自淘宝 ID：黄晶宝石; 封装库来自淘宝卖家 ID：黄晶宝石: 其他店铺购入均为盗版，不享受售后技术支持服务，请立即申请退款; Origin Footprint: R 0201_L; OriginFootprint 2: R 0402_L; OriginFootprint 3: R 0805_L; OriginFootprint 4: R 1206_L; OriginFootprint 5: R 1210_L; OriginFootprint 6: R 1812_L; OriginFootprint 7: R 2010_L; OriginFootprint 8: R 2512_L; OriginFootprint 9: R 0201_M; OriginFootprint 10: R 0402_M; OriginFootprint 11: R 0603_M; OriginFootprint 12: R 0805_M; OriginFootprint 13: R 1206_M; OriginFootprint 14: R 1210_M; OriginFootprint 15: R 1812_M; OriginFootprint 16: R 2010_M; OriginFootprint 17: R 2512_M; UniqueId: b304d0fb6138316f; AddInBom: yes; OriginModelName: R 0603; Device: R; BOM名称: 贴片电阻; 联系售后: https://shop463601444.taobao.com; DesignItemID: R; LibraryName: 0.1 - 电阻-电容-电感; SymbolName: R; FootprintName: R 0603_L
R190 = R: 贴片电阻; 版权归属: 来自淘宝 ID：黄晶宝石; 封装库来自淘宝卖家 ID：黄晶宝石: 其他店铺购入均为盗版，不享受售后技术支持服务，请立即申请退款; Origin Footprint: R 0201_L; OriginFootprint 2: R 0402_L; OriginFootprint 3: R 0805_L; OriginFootprint 4: R 1206_L; OriginFootprint 5: R 1210_L; OriginFootprint 6: R 1812_L; OriginFootprint 7: R 2010_L; OriginFootprint 8: R 2512_L; OriginFootprint 9: R 0201_M; OriginFootprint 10: R 0402_M; OriginFootprint 11: R 0603_M; OriginFootprint 12: R 0805_M; OriginFootprint 13: R 1206_M; OriginFootprint 14: R 1210_M; OriginFootprint 15: R 1812_M; OriginFootprint 16: R 2010_M; OriginFootprint 17: R 2512_M; UniqueId: e59f788bc85bcc1f; AddInBom: yes; OriginModelName: R 0603; Device: R; BOM名称: 贴片电阻; 联系售后: https://shop463601444.taobao.com; DesignItemID: R; LibraryName: 0.1 - 电阻-电容-电感; SymbolName: R; FootprintName: R 0603_L
R191 = R: 贴片电阻; 版权归属: 来自淘宝 ID：黄晶宝石; 封装库来自淘宝卖家 ID：黄晶宝石: 其他店铺购入均为盗版，不享受售后技术支持服务，请立即申请退款; Origin Footprint: R 0201_L; OriginFootprint 2: R 0402_L; OriginFootprint 3: R 0805_L; OriginFootprint 4: R 1206_L; OriginFootprint 5: R 1210_L; OriginFootprint 6: R 1812_L; OriginFootprint 7: R 2010_L; OriginFootprint 8: R 2512_L; OriginFootprint 9: R 0201_M; OriginFootprint 10: R 0402_M; OriginFootprint 11: R 0603_M; OriginFootprint 12: R 0805_M; OriginFootprint 13: R 1206_M; OriginFootprint 14: R 1210_M; OriginFootprint 15: R 1812_M; OriginFootprint 16: R 2010_M; OriginFootprint 17: R 2512_M; UniqueId: e262797b4e338b99; AddInBom: yes; OriginModelName: R 0603; Device: R; BOM名称: 贴片电阻; 联系售后: https://shop463601444.taobao.com; DesignItemID: R; LibraryName: 0.1 - 电阻-电容-电感; SymbolName: R; FootprintName: R 0603_L
R192 = R: 贴片电阻; 版权归属: 来自淘宝 ID：黄晶宝石; 封装库来自淘宝卖家 ID：黄晶宝石: 其他店铺购入均为盗版，不享受售后技术支持服务，请立即申请退款; Origin Footprint: R 0201_L; OriginFootprint 2: R 0402_L; OriginFootprint 3: R 0805_L; OriginFootprint 4: R 1206_L; OriginFootprint 5: R 1210_L; OriginFootprint 6: R 1812_L; OriginFootprint 7: R 2010_L; OriginFootprint 8: R 2512_L; OriginFootprint 9: R 0201_M; OriginFootprint 10: R 0402_M; OriginFootprint 11: R 0603_M; OriginFootprint 12: R 0805_M; OriginFootprint 13: R 1206_M; OriginFootprint 14: R 1210_M; OriginFootprint 15: R 1812_M; OriginFootprint 16: R 2010_M; OriginFootprint 17: R 2512_M; UniqueId: 4edf9ccd7d55be5d; AddInBom: yes; OriginModelName: R 0603; Device: R; BOM名称: 贴片电阻; 联系售后: https://shop463601444.taobao.com; DesignItemID: R; LibraryName: 0.1 - 电阻-电容-电感; SymbolName: R; FootprintName: R 0603_L
R193 = R: 贴片电阻; 版权归属: 来自淘宝 ID：黄晶宝石; 封装库来自淘宝卖家 ID：黄晶宝石: 其他店铺购入均为盗版，不享受售后技术支持服务，请立即申请退款; Origin Footprint: R 0201_L; OriginFootprint 2: R 0402_L; OriginFootprint 3: R 0805_L; OriginFootprint 4: R 1206_L; OriginFootprint 5: R 1210_L; OriginFootprint 6: R 1812_L; OriginFootprint 7: R 2010_L; OriginFootprint 8: R 2512_L; OriginFootprint 9: R 0201_M; OriginFootprint 10: R 0402_M; OriginFootprint 11: R 0603_M; OriginFootprint 12: R 0805_M; OriginFootprint 13: R 1206_M; OriginFootprint 14: R 1210_M; OriginFootprint 15: R 1812_M; OriginFootprint 16: R 2010_M; OriginFootprint 17: R 2512_M; UniqueId: 9e0eccf13a6f31a8; AddInBom: yes; OriginModelName: R 0603; Device: R; BOM名称: 贴片电阻; 联系售后: https://shop463601444.taobao.com; DesignItemID: R; LibraryName: 0.1 - 电阻-电容-电感; SymbolName: R; FootprintName: R 0603_L
R194 = R: 贴片电阻; 版权归属: 来自淘宝 ID：黄晶宝石; 封装库来自淘宝卖家 ID：黄晶宝石: 其他店铺购入均为盗版，不享受售后技术支持服务，请立即申请退款; Origin Footprint: R 0201_L; OriginFootprint 2: R 0402_L; OriginFootprint 3: R 0805_L; OriginFootprint 4: R 1206_L; OriginFootprint 5: R 1210_L; OriginFootprint 6: R 1812_L; OriginFootprint 7: R 2010_L; OriginFootprint 8: R 2512_L; OriginFootprint 9: R 0201_M; OriginFootprint 10: R 0402_M; OriginFootprint 11: R 0603_M; OriginFootprint 12: R 0805_M; OriginFootprint 13: R 1206_M; OriginFootprint 14: R 1210_M; OriginFootprint 15: R 1812_M; OriginFootprint 16: R 2010_M; OriginFootprint 17: R 2512_M; UniqueId: a6178234e12ca1a3; AddInBom: yes; OriginModelName: R 0603; Device: R; BOM名称: 贴片电阻; 联系售后: https://shop463601444.taobao.com; DesignItemID: R; LibraryName: 0.1 - 电阻-电容-电感; SymbolName: R; FootprintName: R 0603_L
R196 = R: 贴片电阻; 版权归属: 来自淘宝 ID：黄晶宝石; 封装库来自淘宝卖家 ID：黄晶宝石: 其他店铺购入均为盗版，不享受售后技术支持服务，请立即申请退款; Origin Footprint: R 0201_L; OriginFootprint 2: R 0402_L; OriginFootprint 3: R 0805_L; OriginFootprint 4: R 1206_L; OriginFootprint 5: R 1210_L; OriginFootprint 6: R 1812_L; OriginFootprint 7: R 2010_L; OriginFootprint 8: R 2512_L; OriginFootprint 9: R 0201_M; OriginFootprint 10: R 0402_M; OriginFootprint 11: R 0603_M; OriginFootprint 12: R 0805_M; OriginFootprint 13: R 1206_M; OriginFootprint 14: R 1210_M; OriginFootprint 15: R 1812_M; OriginFootprint 16: R 2010_M; OriginFootprint 17: R 2512_M; UniqueId: 09b823a69019dbbf; AddInBom: yes; OriginModelName: R 0603; Device: R; BOM名称: 贴片电阻; 联系售后: https://shop463601444.taobao.com; DesignItemID: R; LibraryName: 0.1 - 电阻-电容-电感; SymbolName: R; FootprintName: R 0603_L
R197 = R: 贴片电阻; 版权归属: 来自淘宝 ID：黄晶宝石; 封装库来自淘宝卖家 ID：黄晶宝石: 其他店铺购入均为盗版，不享受售后技术支持服务，请立即申请退款; Origin Footprint: R 0201_L; OriginFootprint 2: R 0402_L; OriginFootprint 3: R 0805_L; OriginFootprint 4: R 1206_L; OriginFootprint 5: R 1210_L; OriginFootprint 6: R 1812_L; OriginFootprint 7: R 2010_L; OriginFootprint 8: R 2512_L; OriginFootprint 9: R 0201_M; OriginFootprint 10: R 0402_M; OriginFootprint 11: R 0603_M; OriginFootprint 12: R 0805_M; OriginFootprint 13: R 1206_M; OriginFootprint 14: R 1210_M; OriginFootprint 15: R 1812_M; OriginFootprint 16: R 2010_M; OriginFootprint 17: R 2512_M; UniqueId: bc27cb7a11a997be; AddInBom: yes; OriginModelName: R 0603; Device: R; BOM名称: 贴片电阻; 联系售后: https://shop463601444.taobao.com; DesignItemID: R; LibraryName: 0.1 - 电阻-电容-电感; SymbolName: R; FootprintName: R 0603_L
R198 = R: 贴片电阻; 版权归属: 来自淘宝 ID：黄晶宝石; 封装库来自淘宝卖家 ID：黄晶宝石: 其他店铺购入均为盗版，不享受售后技术支持服务，请立即申请退款; Origin Footprint: R 0201_L; OriginFootprint 2: R 0402_L; OriginFootprint 3: R 0805_L; OriginFootprint 4: R 1206_L; OriginFootprint 5: R 1210_L; OriginFootprint 6: R 1812_L; OriginFootprint 7: R 2010_L; OriginFootprint 8: R 2512_L; OriginFootprint 9: R 0201_M; OriginFootprint 10: R 0402_M; OriginFootprint 11: R 0603_M; OriginFootprint 12: R 0805_M; OriginFootprint 13: R 1206_M; OriginFootprint 14: R 1210_M; OriginFootprint 15: R 1812_M; OriginFootprint 16: R 2010_M; OriginFootprint 17: R 2512_M; UniqueId: 01fdb669dc90136a; AddInBom: yes; OriginModelName: R 0603; Device: R; BOM名称: 贴片电阻; 联系售后: https://shop463601444.taobao.com; DesignItemID: R; LibraryName: 0.1 - 电阻-电容-电感; SymbolName: R; FootprintName: R 0603_L
R199 = R: 贴片电阻; 版权归属: 来自淘宝 ID：黄晶宝石; 封装库来自淘宝卖家 ID：黄晶宝石: 其他店铺购入均为盗版，不享受售后技术支持服务，请立即申请退款; Origin Footprint: R 0201_L; OriginFootprint 2: R 0402_L; OriginFootprint 3: R 0805_L; OriginFootprint 4: R 1206_L; OriginFootprint 5: R 1210_L; OriginFootprint 6: R 1812_L; OriginFootprint 7: R 2010_L; OriginFootprint 8: R 2512_L; OriginFootprint 9: R 0201_M; OriginFootprint 10: R 0402_M; OriginFootprint 11: R 0603_M; OriginFootprint 12: R 0805_M; OriginFootprint 13: R 1206_M; OriginFootprint 14: R 1210_M; OriginFootprint 15: R 1812_M; OriginFootprint 16: R 2010_M; OriginFootprint 17: R 2512_M; UniqueId: e4d4da7e660617df; AddInBom: yes; OriginModelName: R 0603; Device: R; BOM名称: 贴片电阻; 联系售后: https://shop463601444.taobao.com; DesignItemID: R; LibraryName: 0.1 - 电阻-电容-电感; SymbolName: R; FootprintName: R 0603_L
R201 = R: 贴片电阻; 版权归属: 来自淘宝 ID：黄晶宝石; 封装库来自淘宝卖家 ID：黄晶宝石: 其他店铺购入均为盗版，不享受售后技术支持服务，请立即申请退款; Origin Footprint: R 0201_L; OriginFootprint 2: R 0402_L; OriginFootprint 3: R 0805_L; OriginFootprint 4: R 1206_L; OriginFootprint 5: R 1210_L; OriginFootprint 6: R 1812_L; OriginFootprint 7: R 2010_L; OriginFootprint 8: R 2512_L; OriginFootprint 9: R 0201_M; OriginFootprint 10: R 0402_M; OriginFootprint 11: R 0603_M; OriginFootprint 12: R 0805_M; OriginFootprint 13: R 1206_M; OriginFootprint 14: R 1210_M; OriginFootprint 15: R 1812_M; OriginFootprint 16: R 2010_M; OriginFootprint 17: R 2512_M; UniqueId: a6f8c12e5677218f; AddInBom: yes; OriginModelName: R 0603; Device: R; BOM名称: 贴片电阻; 联系售后: https://shop463601444.taobao.com; DesignItemID: R; LibraryName: 0.1 - 电阻-电容-电感; SymbolName: R; FootprintName: R 0603_L
R202 = R: 贴片电阻; 版权归属: 来自淘宝 ID：黄晶宝石; 封装库来自淘宝卖家 ID：黄晶宝石: 其他店铺购入均为盗版，不享受售后技术支持服务，请立即申请退款; Origin Footprint: R 0201_L; OriginFootprint 2: R 0402_L; OriginFootprint 3: R 0805_L; OriginFootprint 4: R 1206_L; OriginFootprint 5: R 1210_L; OriginFootprint 6: R 1812_L; OriginFootprint 7: R 2010_L; OriginFootprint 8: R 2512_L; OriginFootprint 9: R 0201_M; OriginFootprint 10: R 0402_M; OriginFootprint 11: R 0603_M; OriginFootprint 12: R 0805_M; OriginFootprint 13: R 1206_M; OriginFootprint 14: R 1210_M; OriginFootprint 15: R 1812_M; OriginFootprint 16: R 2010_M; OriginFootprint 17: R 2512_M; UniqueId: da75effbc0c418b2; AddInBom: yes; OriginModelName: R 0603; Device: R; BOM名称: 贴片电阻; 联系售后: https://shop463601444.taobao.com; DesignItemID: R; LibraryName: 0.1 - 电阻-电容-电感; SymbolName: R; FootprintName: R 0603_L
R203 = R: 贴片电阻; 版权归属: 来自淘宝 ID：黄晶宝石; 封装库来自淘宝卖家 ID：黄晶宝石: 其他店铺购入均为盗版，不享受售后技术支持服务，请立即申请退款; Origin Footprint: R 0201_L; OriginFootprint 2: R 0402_L; OriginFootprint 3: R 0805_L; OriginFootprint 4: R 1206_L; OriginFootprint 5: R 1210_L; OriginFootprint 6: R 1812_L; OriginFootprint 7: R 2010_L; OriginFootprint 8: R 2512_L; OriginFootprint 9: R 0201_M; OriginFootprint 10: R 0402_M; OriginFootprint 11: R 0603_M; OriginFootprint 12: R 0805_M; OriginFootprint 13: R 1206_M; OriginFootprint 14: R 1210_M; OriginFootprint 15: R 1812_M; OriginFootprint 16: R 2010_M; OriginFootprint 17: R 2512_M; UniqueId: 41260ea8bae6dc8d; AddInBom: yes; OriginModelName: R 0603; Device: R; BOM名称: 贴片电阻; 联系售后: https://shop463601444.taobao.com; DesignItemID: R; LibraryName: 0.1 - 电阻-电容-电感; SymbolName: R; FootprintName: R 0603_L
R204 = R: 贴片电阻; 版权归属: 来自淘宝 ID：黄晶宝石; 封装库来自淘宝卖家 ID：黄晶宝石: 其他店铺购入均为盗版，不享受售后技术支持服务，请立即申请退款; Origin Footprint: R 0201_L; OriginFootprint 2: R 0402_L; OriginFootprint 3: R 0805_L; OriginFootprint 4: R 1206_L; OriginFootprint 5: R 1210_L; OriginFootprint 6: R 1812_L; OriginFootprint 7: R 2010_L; OriginFootprint 8: R 2512_L; OriginFootprint 9: R 0201_M; OriginFootprint 10: R 0402_M; OriginFootprint 11: R 0603_M; OriginFootprint 12: R 0805_M; OriginFootprint 13: R 1206_M; OriginFootprint 14: R 1210_M; OriginFootprint 15: R 1812_M; OriginFootprint 16: R 2010_M; OriginFootprint 17: R 2512_M; UniqueId: df29ef2d077fcbbf; AddInBom: yes; OriginModelName: R 0603; Device: R; BOM名称: 贴片电阻; 联系售后: https://shop463601444.taobao.com; DesignItemID: R; LibraryName: 0.1 - 电阻-电容-电感; SymbolName: R; FootprintName: R 0603_L
R205 = R: 贴片电阻; 版权归属: 来自淘宝 ID：黄晶宝石; 封装库来自淘宝卖家 ID：黄晶宝石: 其他店铺购入均为盗版，不享受售后技术支持服务，请立即申请退款; Origin Footprint: R 0201_L; OriginFootprint 2: R 0402_L; OriginFootprint 3: R 0805_L; OriginFootprint 4: R 1206_L; OriginFootprint 5: R 1210_L; OriginFootprint 6: R 1812_L; OriginFootprint 7: R 2010_L; OriginFootprint 8: R 2512_L; OriginFootprint 9: R 0201_M; OriginFootprint 10: R 0402_M; OriginFootprint 11: R 0603_M; OriginFootprint 12: R 0805_M; OriginFootprint 13: R 1206_M; OriginFootprint 14: R 1210_M; OriginFootprint 15: R 1812_M; OriginFootprint 16: R 2010_M; OriginFootprint 17: R 2512_M; UniqueId: e988a913e3416cdd; AddInBom: yes; OriginModelName: R 0603; Device: R; BOM名称: 贴片电阻; 联系售后: https://shop463601444.taobao.com; DesignItemID: R; LibraryName: 0.1 - 电阻-电容-电感; SymbolName: R; FootprintName: R 0603_L
R206 = R: 贴片电阻; 版权归属: 来自淘宝 ID：黄晶宝石; 封装库来自淘宝卖家 ID：黄晶宝石: 其他店铺购入均为盗版，不享受售后技术支持服务，请立即申请退款; Origin Footprint: R 0201_L; OriginFootprint 2: R 0402_L; OriginFootprint 3: R 0805_L; OriginFootprint 4: R 1206_L; OriginFootprint 5: R 1210_L; OriginFootprint 6: R 1812_L; OriginFootprint 7: R 2010_L; OriginFootprint 8: R 2512_L; OriginFootprint 9: R 0201_M; OriginFootprint 10: R 0402_M; OriginFootprint 11: R 0603_M; OriginFootprint 12: R 0805_M; OriginFootprint 13: R 1206_M; OriginFootprint 14: R 1210_M; OriginFootprint 15: R 1812_M; OriginFootprint 16: R 2010_M; OriginFootprint 17: R 2512_M; UniqueId: a1dc1d7ffb4193e6; AddInBom: yes; OriginModelName: R 0603; Device: R; BOM名称: 贴片电阻; 联系售后: https://shop463601444.taobao.com; DesignItemID: R; LibraryName: 0.1 - 电阻-电容-电感; SymbolName: R; FootprintName: R 0603_L
R207 = R: 贴片电阻; 版权归属: 来自淘宝 ID：黄晶宝石; 封装库来自淘宝卖家 ID：黄晶宝石: 其他店铺购入均为盗版，不享受售后技术支持服务，请立即申请退款; Origin Footprint: R 0201_L; OriginFootprint 2: R 0402_L; OriginFootprint 3: R 0805_L; OriginFootprint 4: R 1206_L; OriginFootprint 5: R 1210_L; OriginFootprint 6: R 1812_L; OriginFootprint 7: R 2010_L; OriginFootprint 8: R 2512_L; OriginFootprint 9: R 0201_M; OriginFootprint 10: R 0402_M; OriginFootprint 11: R 0603_M; OriginFootprint 12: R 0805_M; OriginFootprint 13: R 1206_M; OriginFootprint 14: R 1210_M; OriginFootprint 15: R 1812_M; OriginFootprint 16: R 2010_M; OriginFootprint 17: R 2512_M; UniqueId: 94189e0415d5623f; AddInBom: yes; OriginModelName: R 0603; Device: R; BOM名称: 贴片电阻; 联系售后: https://shop463601444.taobao.com; DesignItemID: R; LibraryName: 0.1 - 电阻-电容-电感; SymbolName: R; FootprintName: R 0603_L
R208 = R: 贴片电阻; 版权归属: 来自淘宝 ID：黄晶宝石; 封装库来自淘宝卖家 ID：黄晶宝石: 其他店铺购入均为盗版，不享受售后技术支持服务，请立即申请退款; Origin Footprint: R 0201_L; OriginFootprint 2: R 0402_L; OriginFootprint 3: R 0805_L; OriginFootprint 4: R 1206_L; OriginFootprint 5: R 1210_L; OriginFootprint 6: R 1812_L; OriginFootprint 7: R 2010_L; OriginFootprint 8: R 2512_L; OriginFootprint 9: R 0201_M; OriginFootprint 10: R 0402_M; OriginFootprint 11: R 0603_M; OriginFootprint 12: R 0805_M; OriginFootprint 13: R 1206_M; OriginFootprint 14: R 1210_M; OriginFootprint 15: R 1812_M; OriginFootprint 16: R 2010_M; OriginFootprint 17: R 2512_M; UniqueId: acf15e2cdf1c818f; AddInBom: yes; OriginModelName: R 0603; Device: R; BOM名称: 贴片电阻; 联系售后: https://shop463601444.taobao.com; DesignItemID: R; LibraryName: 0.1 - 电阻-电容-电感; SymbolName: R; FootprintName: R 0603_L
R209 = R: 贴片电阻; 版权归属: 来自淘宝 ID：黄晶宝石; 封装库来自淘宝卖家 ID：黄晶宝石: 其他店铺购入均为盗版，不享受售后技术支持服务，请立即申请退款; Origin Footprint: R 0201_L; OriginFootprint 2: R 0402_L; OriginFootprint 3: R 0805_L; OriginFootprint 4: R 1206_L; OriginFootprint 5: R 1210_L; OriginFootprint 6: R 1812_L; OriginFootprint 7: R 2010_L; OriginFootprint 8: R 2512_L; OriginFootprint 9: R 0201_M; OriginFootprint 10: R 0402_M; OriginFootprint 11: R 0603_M; OriginFootprint 12: R 0805_M; OriginFootprint 13: R 1206_M; OriginFootprint 14: R 1210_M; OriginFootprint 15: R 1812_M; OriginFootprint 16: R 2010_M; OriginFootprint 17: R 2512_M; UniqueId: 3520350cb8a16ddf; AddInBom: yes; OriginModelName: R 0603; Device: R; BOM名称: 贴片电阻; 联系售后: https://shop463601444.taobao.com; DesignItemID: R; LibraryName: 0.1 - 电阻-电容-电感; SymbolName: R; FootprintName: R 0603_L
R210 = R: 贴片电阻; 版权归属: 来自淘宝 ID：黄晶宝石; 封装库来自淘宝卖家 ID：黄晶宝石: 其他店铺购入均为盗版，不享受售后技术支持服务，请立即申请退款; Origin Footprint: R 0201_L; OriginFootprint 2: R 0402_L; OriginFootprint 3: R 0805_L; OriginFootprint 4: R 1206_L; OriginFootprint 5: R 1210_L; OriginFootprint 6: R 1812_L; OriginFootprint 7: R 2010_L; OriginFootprint 8: R 2512_L; OriginFootprint 9: R 0201_M; OriginFootprint 10: R 0402_M; OriginFootprint 11: R 0603_M; OriginFootprint 12: R 0805_M; OriginFootprint 13: R 1206_M; OriginFootprint 14: R 1210_M; OriginFootprint 15: R 1812_M; OriginFootprint 16: R 2010_M; OriginFootprint 17: R 2512_M; UniqueId: ff64ea784eb901ab; AddInBom: yes; OriginModelName: R 0603; Device: R; BOM名称: 贴片电阻; 联系售后: https://shop463601444.taobao.com; DesignItemID: R; LibraryName: 0.1 - 电阻-电容-电感; SymbolName: R; FootprintName: R 0603_L
R211 = R: 贴片电阻; 版权归属: 来自淘宝 ID：黄晶宝石; 封装库来自淘宝卖家 ID：黄晶宝石: 其他店铺购入均为盗版，不享受售后技术支持服务，请立即申请退款; Origin Footprint: R 0201_L; OriginFootprint 2: R 0402_L; OriginFootprint 3: R 0805_L; OriginFootprint 4: R 1206_L; OriginFootprint 5: R 1210_L; OriginFootprint 6: R 1812_L; OriginFootprint 7: R 2010_L; OriginFootprint 8: R 2512_L; OriginFootprint 9: R 0201_M; OriginFootprint 10: R 0402_M; OriginFootprint 11: R 0603_M; OriginFootprint 12: R 0805_M; OriginFootprint 13: R 1206_M; OriginFootprint 14: R 1210_M; OriginFootprint 15: R 1812_M; OriginFootprint 16: R 2010_M; OriginFootprint 17: R 2512_M; UniqueId: 1887dacec97403d3; AddInBom: yes; OriginModelName: R 0603; Device: R; BOM名称: 贴片电阻; 联系售后: https://shop463601444.taobao.com; DesignItemID: R; LibraryName: 0.1 - 电阻-电容-电感; SymbolName: R; FootprintName: R 0603_L
R212 = R: 贴片电阻; 版权归属: 来自淘宝 ID：黄晶宝石; 封装库来自淘宝卖家 ID：黄晶宝石: 其他店铺购入均为盗版，不享受售后技术支持服务，请立即申请退款; Origin Footprint: R 0201_L; OriginFootprint 2: R 0402_L; OriginFootprint 3: R 0805_L; OriginFootprint 4: R 1206_L; OriginFootprint 5: R 1210_L; OriginFootprint 6: R 1812_L; OriginFootprint 7: R 2010_L; OriginFootprint 8: R 2512_L; OriginFootprint 9: R 0201_M; OriginFootprint 10: R 0402_M; OriginFootprint 11: R 0603_M; OriginFootprint 12: R 0805_M; OriginFootprint 13: R 1206_M; OriginFootprint 14: R 1210_M; OriginFootprint 15: R 1812_M; OriginFootprint 16: R 2010_M; OriginFootprint 17: R 2512_M; UniqueId: 90aa3c19b060f889; AddInBom: yes; OriginModelName: R 0603; Device: R; BOM名称: 贴片电阻; 联系售后: https://shop463601444.taobao.com; DesignItemID: R; LibraryName: 0.1 - 电阻-电容-电感; SymbolName: R; FootprintName: R 0603_L
R213 = R: 贴片电阻; 版权归属: 来自淘宝 ID：黄晶宝石; 封装库来自淘宝卖家 ID：黄晶宝石: 其他店铺购入均为盗版，不享受售后技术支持服务，请立即申请退款; Origin Footprint: R 0201_L; OriginFootprint 2: R 0402_L; OriginFootprint 3: R 0805_L; OriginFootprint 4: R 1206_L; OriginFootprint 5: R 1210_L; OriginFootprint 6: R 1812_L; OriginFootprint 7: R 2010_L; OriginFootprint 8: R 2512_L; OriginFootprint 9: R 0201_M; OriginFootprint 10: R 0402_M; OriginFootprint 11: R 0603_M; OriginFootprint 12: R 0805_M; OriginFootprint 13: R 1206_M; OriginFootprint 14: R 1210_M; OriginFootprint 15: R 1812_M; OriginFootprint 16: R 2010_M; OriginFootprint 17: R 2512_M; UniqueId: 28145adf450505d9; AddInBom: yes; OriginModelName: R 0603; Device: R; BOM名称: 贴片电阻; 联系售后: https://shop463601444.taobao.com; DesignItemID: R; LibraryName: 0.1 - 电阻-电容-电感; SymbolName: R; FootprintName: R 0603_L